# Altium schematic sheet CH585M_BLE_Touch_Lock.SchDoc
size A3
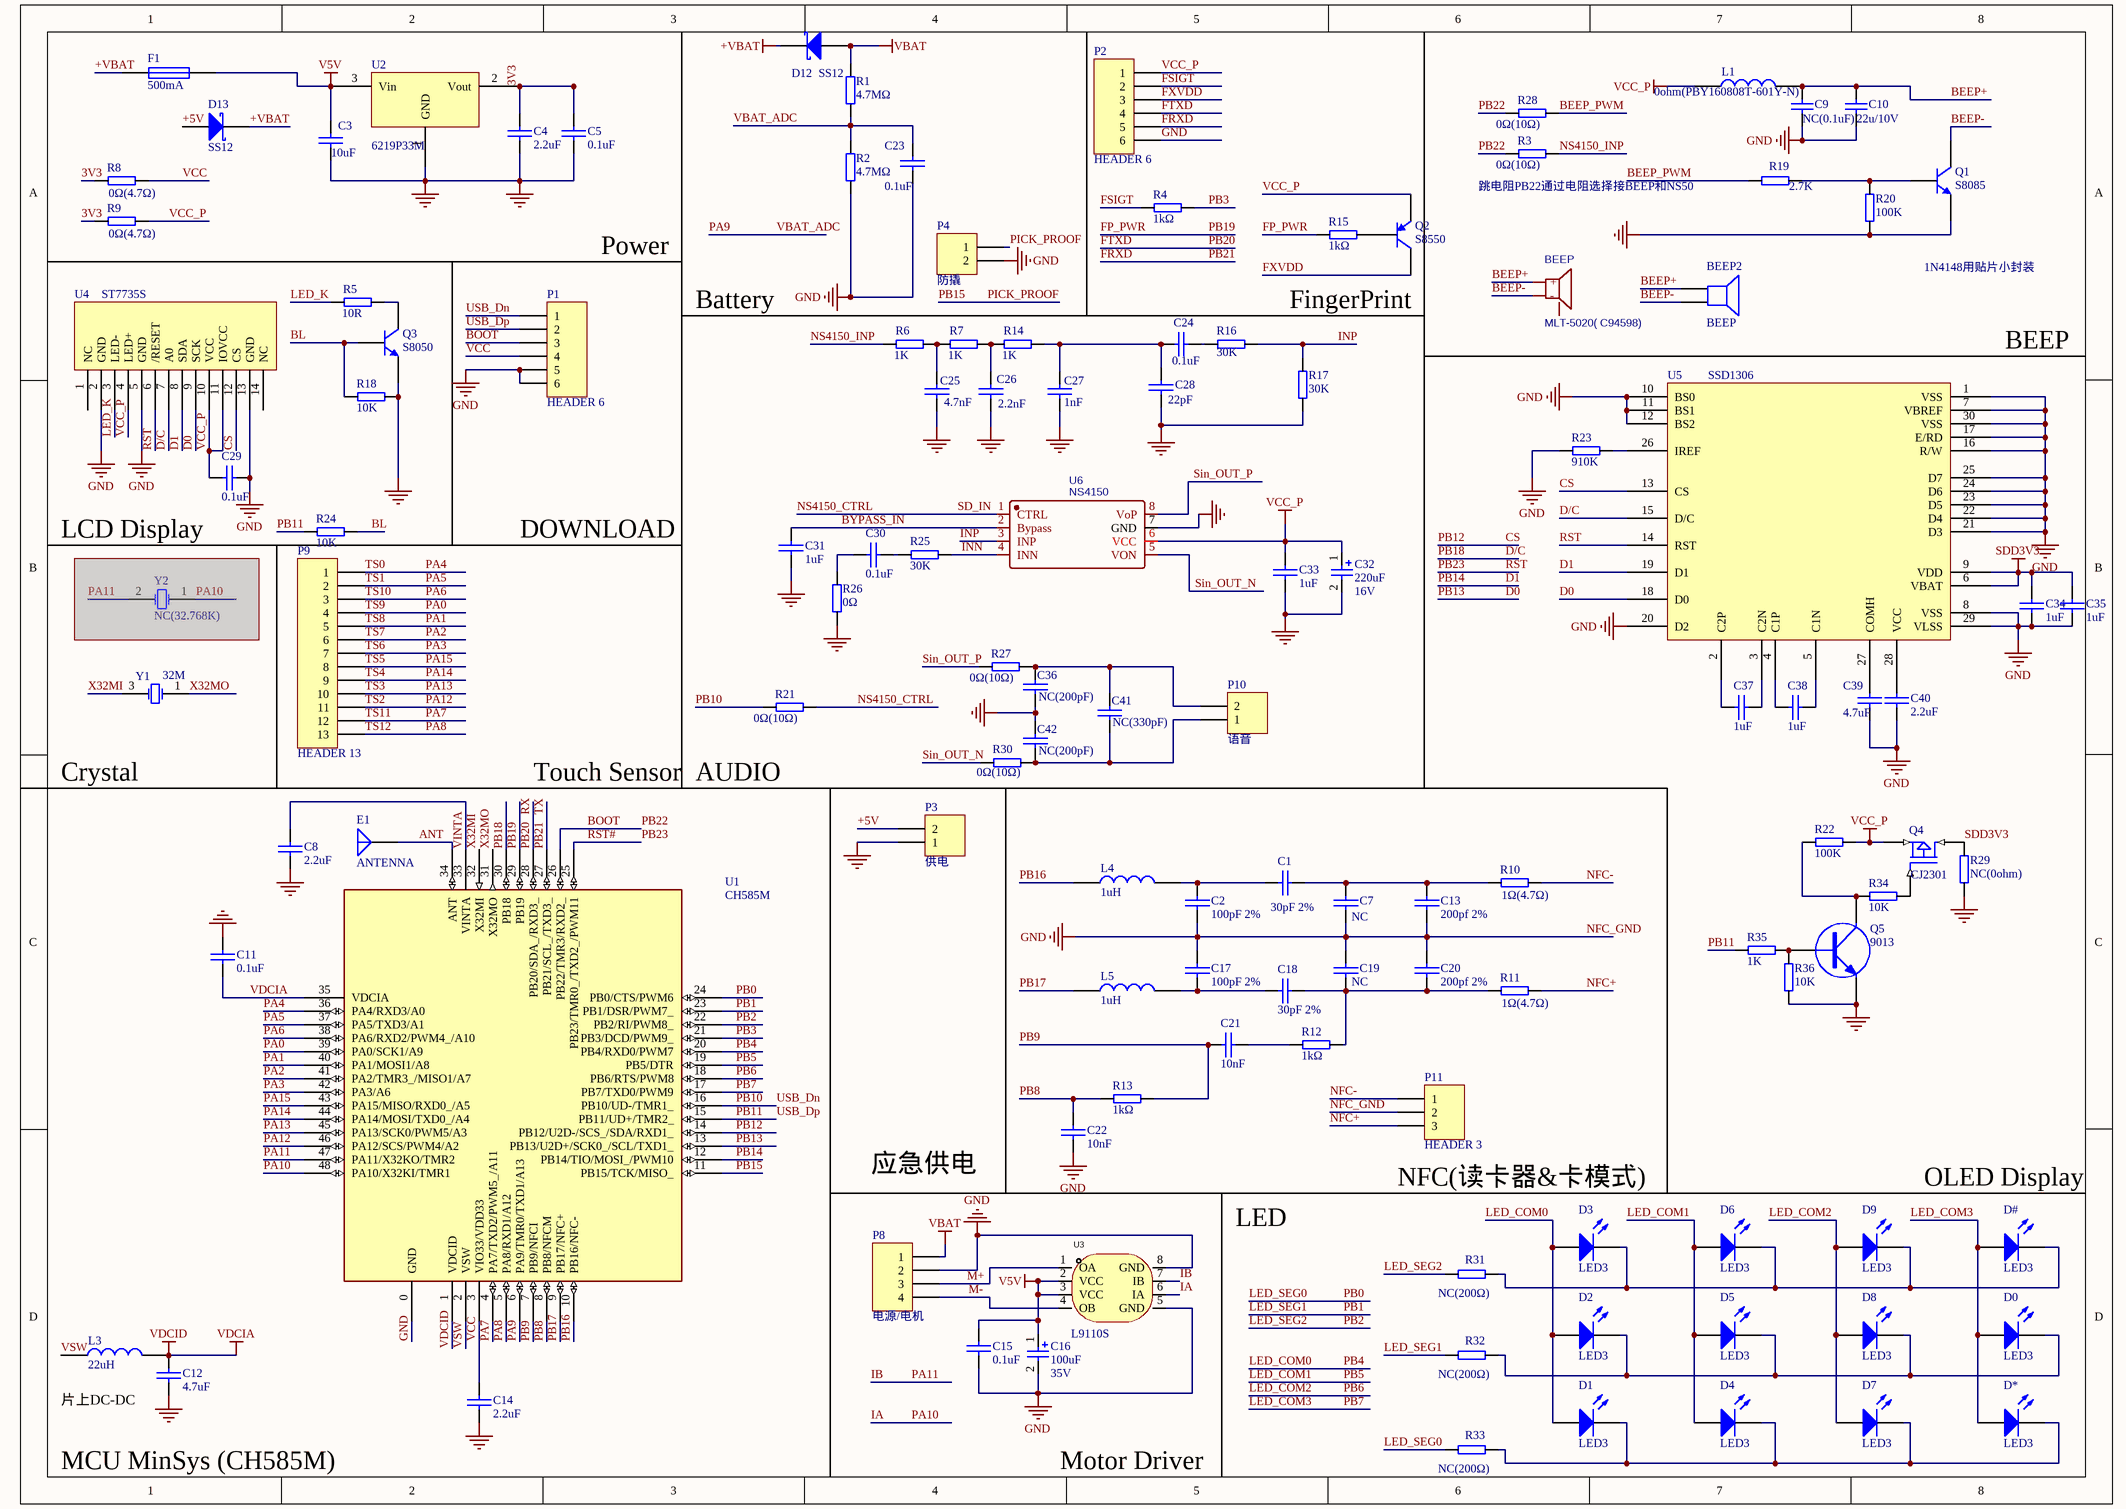
[diagram p0: CH585M_BLE_Touch_Lock.SchDoc]

## Parts
BEEP  MLT-5020( C94598)  [BUZ-SMD_3P-L5.2-W5.2-P3.50-BR]
BEEP2  BEEP  [FMQX]
C1  30pF 2%  [0402_C]
C2  100pF 2%  [0402_C]
C3  10uF  [0603_C]
C4  2.2uF  [0402_C]
C5  0.1uF  [0402_C]
C7  NC  [0402_C]
C8  2.2uF  [0402_C]
C9  NC(0.1uF)  [0402_C]
C10  22u/10V  [0805_C]
C11  0.1uF  [0402_C]
C12  4.7uF  [0402_C]
C13  200pf 2%  [0402_C]
C14  2.2uF  [0402_C]
C15  0.1uF  [0402_C]
C16  Voltage: 35V  [CAP-SMD_BD6.3-L6.6-W6.6-FD]  (hidden comment: 100uF)
C17  100pF 2%  [0402_C]
C18  30pF 2%  [0402_C]
C19  NC  [0402_C]
C20  200pf 2%  [0402_C]
C21  10nF  [0402_C]
C22  10nF  [0402_C]
C23  0.1uF  [0402_C]
C24  0.1uF  [0402_C]
C25  4.7nF  [0402_C]
C26  2.2nF  [0402_C]
C27  1nF  [0402_C]
C28  22pF  [0402_C]
C29  0.1uF  [0402_C]
C30  0.1uF  [0402_C]
C31  1uF  [0402_C]
C32  Voltage: 16V  [CAP-SMD_BD6.3-L6.6-W6.6-FD]  (hidden comment: 220uF)
C33  1uF  [0402_C]
C34  1uF  [0402_C]
C35  1uF  [0402_C]
C36  NC(200pF)  [0402_C]
C37  1uF  [0402_C]
C38  1uF  [0402_C]
C39  4.7uF  [0402_C]
C40  2.2uF  [0402_C]
C41  NC(330pF)  [0402_C]
C42  NC(200pF)  [0402_C]
D0  LED3  [0603+]
D1  LED3  [0603+]
D2  LED3  [0603+]
D3  LED3  [0603+]
D4  LED3  [0603+]
D5  LED3  [0603+]
D6  LED3  [0603+]
D7  LED3  [0603+]
D8  LED3  [0603+]
D9  LED3  [0603+]
D12  SS12  [7227+]
D13  SS12  [7227+]
D#  LED3  [0603+]
D*  LED3  [0603+]
E1  ANTENNA  [ANT-F-1-2.4G-1.6mmFR4]
F1  500mA  [0603]
L1  0ohm(PBY160808T-601Y-N)  [0603]
L3  22uH  [SMD_2x2mm]
L4  1uH  [0603]
L5  1uH  [0603]
P1  HEADER 6  [SIP6-1MM]
P2  HEADER 6  [FPC-P0.50-6P]
P3  供电  [CONN-SMD_P1.25-H_1.25T-2PWT]
P4  防撬  [CONN-SMD_P1.25-H_1.25T-2PWT]
P8  电源/电机  [CONN-SMD_HY2.0-4P]
P9  HEADER 13  [SIP13-2.54mm]
P10  语音  [CONN-SMD_P1.25-H_1.25T-2PWT]
P11  HEADER 3  [SIP3-2.54MM]
Q1  S8085  [SOT-23]
Q2  S8550  [SOT-23]
Q3  S8050  [SOT-23]
Q4  CJ2301  [SOT-23]
Q5  9013  [SOT-23]
R1  4.7MΩ  [0402]
R2  4.7MΩ  [0402]
R3  0Ω(10Ω)  [0402]
R4  1kΩ  [0402]
R5  10R  [0402]
R6  1K  [0402]
R7  1K  [0402]
R8  0Ω(4.7Ω)  [0402]
R9  0Ω(4.7Ω)  [0402]
R10  1Ω(4.7Ω)  [0402]
R11  1Ω(4.7Ω)  [0402]
R12  1kΩ  [0402]
R13  1kΩ  [0402]
R14  1K  [0402]
R15  1kΩ  [0402]
R16  30K  [0402]
R17  30K  [0402]
R18  10K  [0402]
R19  2.7K  [0402]
R20  100K  [0402]
R21  0Ω(10Ω)  [0402]
R22  100K  [0402]
R23  910K  [0402]
R24  10K  [0402]
R25  30K  [0402]
R26  0Ω  [0402]
R27  0Ω(10Ω)  [0402]
R28  0Ω(10Ω)  [0402]
R29  NC(0ohm)  [0402]
R30  0Ω(10Ω)  [0402]
R31  NC(200Ω)  [0402]
R32  NC(200Ω)  [0402]
R33  NC(200Ω)  [0402]
R34  10K  [0402]
R35  1K  [0402]
R36  10K  [0402]
U1  CH585M  [QFN48_5X5]
U2  6219P33M  [SOT-23]
U3  L9110S  [SOP-8_L6.1-W3.9-P1.27-LS6.0-BL-1]
U4  ST7735S  [FPC-P0.50-14P-REV]
U5  SSD1306  [FPC-P0.50-30P]
U6  NS4150  [MSOP8]
Y1  32M  [XT3225]
Y2  NC(32.768K)  [FC-135]  (masked out: inside a compile mask, not in the netlist)

## Nets
+VBAT: D12.2(K) D13.2(K) F1.1
GND: C2.1 C3.2 C4.2 C5.2 C7.1 C8.2 C9.1 C10.2 C11.2 C12.1 C13.1 C14.1 C15.1 C16.2 C17.2 C19.2 C20.2 C22.2 C23.2 C25.2 C26.2 C27.2 C28.1 C29.1 C31.1 C32.2 C33.2 C34.1 C35.1 C36.2 C39.1 C40.1 C42.2 P1.5 P1.6 P2.6 P3.1 P4.2 P8.2 P11.2 Q1.2(E) Q3.2(E) Q5.2(E) R2.2 R17.2 R18.2 R20.1 R23.1 R26.2 R29.2 R36.2 U1.0(GND) U2.1(GND) U3.5(GND) U3.8(GND) U4.2(GND) U4.5(GND) U4.13(GND) U5.1(VSS) U5.7(VBREF) U5.8(VSS) U5.10(BS0) U5.11(BS1) U5.12(BS2) U5.16(R/W) U5.17(E/RD) U5.20(D2) U5.21(D3) U5.22(D4) U5.23(D5) U5.24(D6) U5.25(D7) U5.29(VLSS) U5.30(VSS) U6.7(GND)  [also labelled NFC_GND]
SDD3V3: C34.2 C35.2 Q4.3(D) R29.1 U5.6(VBAT) U5.9(VDD)
V5V: C3.1 C15.2 C16.1 F1.2 U2.3(Vin) U3.2(VCC) U3.3(VCC)
VBAT: D12.1(A) P8.1 R1.1
VCC_P: C29.2 C32.1 C33.1 L1.1 P2.1 Q2.2(E) Q4.2(S) R9.2 R22.2 U4.4(LED+) U4.10(VCC) U4.11(IOVCC) U6.6(VCC)
VDCIA: C11.1 C12.2 L3.2 U1.1(VDCID) U1.35(VDCIA)  [also labelled VDCID]
3V3: C4.1 C5.1 R8.1 R9.1 U2.2(Vout)
+5V: D13.1(A) P3.2
ANT: E1.1(A) U1.34(ANT)
BEEP+: BEEP.2(+) BEEP2.1 C9.2 C10.1 L1.2
BEEP-: BEEP.3(-) BEEP2.2 Q1.3(C)
BEEP_PWM: R19.1 R28.1
BL: Q3.1(B) R18.1 R24.2
BOOT: P1.3 R3.2 R28.2 U1.26(PB22/TMR3/RXD2_)  [also labelled PB22]
BYPASS_IN: C31.2 U6.2(Bypass)
CS: U1.14(PB12/U2D-/SCS_/SDA/RXD1_) U4.12(CS) U5.13(CS)  [also labelled PB12]
D0: U1.13(PB13/U2D+/SCK0_/SCL/TXD1_) U4.9(SCK) U5.18(D0)  [also labelled PB13]
D1: U1.12(PB14/TIO/MOSI_/PWM10) U4.8(SDA) U5.19(D1)  [also labelled PB14]
D/C: U1.30(PB18) U4.7(A0) U5.15(D/C)  [also labelled PB18]
FP_PWR: R15.1 U1.29(PB19)  [also labelled PB19]
FRXD: P2.5 U1.27(PB21/SCL_/TXD3_)  [also labelled PB21, TX]
FSIGT: P2.2 R4.1
FTXD: P2.4 U1.28(PB20/SDA_/RXD3_)  [also labelled PB20, RX]
FXVDD: P2.3 Q2.3(C)
IA: U1.48(PA10/X32KI/TMR1) U3.6(IA)  [also labelled PA10]
IB: U1.47(PA11/X32KO/TMR2) U3.7(IB)  [also labelled PA11]
INN: R25.1 U6.4(INN)
INP: R16.1 R17.1 U6.3(INP)
LED_COM0: D1.1(A) D2.1(A) D3.1(A) U1.20(PB4/RXD0/PWM7)  [also labelled PB4]
LED_COM1: D4.1(A) D5.1(A) D6.1(A) U1.19(PB5/DTR)  [also labelled PB5]
LED_COM2: D7.1(A) D8.1(A) D9.1(A) U1.18(PB6/RTS/PWM8)  [also labelled PB6]
LED_COM3: D0.1(A) D#.1(A) D*.1(A) U1.17(PB7/TXD0/PWM9)  [also labelled PB7]
LED_K: R5.2 U4.3(LED-)
LED_SEG0: R33.1 U1.24(PB0/CTS/PWM6)  [also labelled PB0]
LED_SEG1: R32.1 U1.23(PB1/DSR/PWM7_)  [also labelled PB1]
LED_SEG2: R31.1 U1.22(PB2/RI/PWM8_)  [also labelled PB2]
M+: P8.3 U3.1(OA)
M-: P8.4 U3.4(OB)
NFC+: P11.3 R11.2
NFC-: P11.1 R10.2
NS4150_CTRL: R21.1 U6.1(CTRL)  [also labelled SD_IN]
NS4150_INP: R3.1 R6.2
PA0: P9.4 U1.39(PA0/SCK1/A9)  [also labelled TS9]
PA1: P9.5 U1.40(PA1/MOSI1/A8)  [also labelled TS8]
PA2: P9.6 U1.41(PA2/TMR3_/MISO1/A7)  [also labelled TS7]
PA3: P9.7 U1.42(PA3/A6)  [also labelled TS6]
PA4: P9.1 U1.36(PA4/RXD3/A0)  [also labelled TS0]
PA5: P9.2 U1.37(PA5/TXD3/A1)  [also labelled TS1]
PA6: P9.3 U1.38(PA6/RXD2/PWM4_/A10)  [also labelled TS10]
PA7: P9.12 U1.4(PA7/TXD2/PWM5_/A11)  [also labelled TS11]
PA8: P9.13 U1.5(PA8/RXD1/A12)  [also labelled TS12]
PA9: C23.1 R1.2 R2.1 U1.6(PA9/TMR0/TXD1/A13)  [also labelled VBAT_ADC]
PA12: P9.11 U1.46(PA12/SCS/PWM4/A2)  [also labelled TS2]
PA13: P9.10 U1.45(PA13/SCK0/PWM5/A3)  [also labelled TS3]
PA14: P9.9 U1.44(PA14/MOSI/TXD0_/A4)  [also labelled TS4]
PA15: P9.8 U1.43(PA15/MISO/RXD0_/A5)  [also labelled TS5]
PB3: R4.2 U1.21(PB3/DCD/PWM9_)
PB8: C22.1 R13.1 U1.8(PB8/NFCM)
PB9: C21.2 R13.2 U1.7(PB9/NFCI)
PB10: P1.1 R21.2 U1.16(PB10/UD-/TMR1_)  [also labelled USB_Dn]
PB11: P1.2 R24.1 R35.2 U1.15(PB11/UD+/TMR2_)  [also labelled USB_Dp]
PB15: P4.1 U1.11(PB15/TCK/MISO_)  [also labelled PICK_PROOF]
PB16: L4.1 U1.10(PB16/NFC-)
PB17: L5.1 U1.9(PB17/NFC+)
PB23: U1.25(PB23/TMR0_/TXD2_/PWM11) U4.6(/RESET) U5.14(RST)  [also labelled RST, RST#]
Sin_OUT_N: R30.2 U6.5(VON)
Sin_OUT_P: R27.2 U6.8(VoP)
VCC: C14.2 P1.4 R8.2 U1.3(VIO33/VDD33)
VINTA: C8.1 U1.33(VINTA)
VSW: L3.1 U1.2(VSW)
X32MI: U1.32(X32MI) Y1.3(OSC2)
X32MO: U1.31(X32MO) Y1.1(OSC1)
NetC1_1: C1.1 C2.2 L4.2
NetC1_2: C1.2 C7.2 C13.2 R10.1
NetC17_1: C17.1 C18.1 L5.2
NetC18_2: C18.2 C19.1 C20.1 R11.1 R12.2
NetC21_1: C21.1 R12.1
NetC24_1: C24.1 C27.1 C28.2 R14.1
NetC24_2: C24.2 R16.2
NetC25_1: C25.1 R6.1 R7.2
NetC26_1: C26.1 R7.1 R14.2
NetC30_1: C30.1 R26.1
NetC30_2: C30.2 R25.2
NetC36_1: C36.1 C41.1 P10.2 R27.1
NetC37_1: C37.1 U5.3(C2N)
NetC37_2: C37.2 U5.2(C2P)
NetC38_1: C38.1 U5.5(C1N)
NetC38_2: C38.2 U5.4(C1P)
NetC39_2: C39.2 U5.27(COMH)
NetC40_2: C40.2 U5.28(VCC)
NetC41_2: C41.2 C42.1 P10.1 R30.1
NetD0_2: D0.2(K) D2.2(K) D5.2(K) D8.2(K) R32.2
NetD1_2: D1.2(K) D4.2(K) D7.2(K) D*.2(K) R33.2
NetD3_2: D3.2(K) D6.2(K) D9.2(K) D#.2(K) R31.2
NetQ1_1: Q1.1(B) R19.2 R20.2
NetQ2_1: Q2.1(B) R15.2
NetQ3_3: Q3.3(C) R5.1
NetQ4_1: Q4.1(G) R34.2
NetQ5_1: Q5.1(B) R35.1 R36.1
NetQ5_3: Q5.3(C) R22.1 R34.1
NetR23_2: R23.2 U5.26(IREF)

Not connected (* = marked no-connect by the designer): BEEP 1(NC); U4 1(NC) 14(NC)

## Notes on the sheet
- (near R3) 跳电阻PB22通过电阻选择接BEEP和NS50
- Power
- Battery
- FingerPrint
- 1N4148用贴片小封装
- BEEP
- LCD Display
- DOWNLOAD
- Crystal
- Touch Sensor
- (near R21) AUDIO
- 应急供电
- NFC(读卡器&卡模式)
- OLED Display
- LED
- 片上DC-DC
- MCU MinSys (CH585M)
- Motor Driver

## Library data of the parts
BEEP = BUZZER: 无源蜂鸣器
C1-C5 C7 C8 C11-C15 C17-C31 C33-C42 = CAP: Capacitor
C9 = Cap Semi: Capacitor (Semiconductor SIM Model); Published: 8-Jun-2000; LatestRevisionDate: 17-Jul-2002; LatestRevisionNote: Re-released for DXP Platform.; PackageReference: C0805; Publisher: Altium Limited
C10 = Cap: Capacitor; Published: 8-Jun-2000; LatestRevisionDate: 17-Jul-2002; LatestRevisionNote: Re-released for DXP Platform.; Publisher: Altium Limited
C16 C32 = Cap_SMT_6.3mm: 贴片电解电容，直径5mm，可查表选型; Published: 8-Jun-2000; Revision: July-2002: Re-released for DXP Platform.; Publisher: Altium Limited; 查表选型: https://wenku.baidu.com/view/07eee7ff284ac850ad02428d.html?sxts=1527779080089
  C16: Value: 100uF
  C32: Value: 220uF
D0-D9 D# D* = LED3: Typical BLUE SiC LED; Published: 8-Jun-2000; LatestRevisionDate: 17-Dec-2003; LatestRevisionNote: PCB Footprint replaced.; DatasheetVersion: 16-Apr-2002; PackageVersion: 16-Apr-2002; PackageReference: 3.5X2.8X1.9; Publisher: Altium Limited; PackageDescription: SM LED; 2 C-Bend Leads; Body 3.5 x 2.8 x 1.9 mm, inc leads (LxWxH typ)
D12 D13 = Schottky Diode: Silicon AF Schottky Diode for High-Speed Switching
E1 = ANTENNA: Generic Antenna
F1 = FUSE1: Fuse
L1 L3-L5 = INDUCTOR
P1 P2 = HEADER 6: Header, 6-Pin
P3 P4 P10 = HEADER 2: 1.25-2P-卧贴/Header, 2-Pin
P8 = HEADER 4: Header, 4-Pin
P9 = HEADER 13: Header, 13-Pin
P11 = HEADER 3: Header, 3-Pin
Q1 Q3 = NPN: NPN BJT
Q2 = PNP: PNP Bipolar Transistor
Q4 = MOSFET P
Q5 = NPN: NPN Transistor
R1 R2 = R
R3-R21 R23-R33 = RES
R22 R34-R36 = Pro4E.tmp_1K_4
U1 = CH585M: RISC-V MCU with BLE/HSUSB/USB/NFC/ADC/PWM/SPI/I2C/4*UART/LCD
U3 = L9110S_C725793: Manufacturer: UMW(友台半导体); Add into BOM: yes; Name: L9110S; Symbol: L9110S_C725793; Device: L9110S_C725793; LCSC Part Name: 低功耗; Supplier Part: C725793; Manufacturer Part: L9110S; Supplier Footprint: SOP-8; JLCPCB Part Class: Extended Part; Datasheet: https://atta.szlcsc.com/upload/public/pdf/source/20220125/8B45A02AA62FA0F244516C79F412D1B9.pdf; Supplier: LCSC; Convert to PCB: yes
U6 = NS4150: BOM_Manufacturer: Shenzhen Nsiway Tech; Contributor: LCSC; SMT Type: Extend; BOM_Supplier: LCSC; BOM_Supplier Part: C189961; BOM_Manufacturer Part: NS4150; BOM_LCSC Assembly: Yes; spicePre: U; spiceSymbolName: NS4150
Y1 Y2 = XTAL: Crystal Oscillator; Published: 8-Jun-2000; LatestRevisionDate: 17-Jul-2002; LatestRevisionNote: Re-released for DXP Platform.; PackageReference: R38; Publisher: Altium Limited; PackageDescription: Crystal, Thru-Hole; 2 Leads; Body 3.1 x 8.2 mm (Dia.xH)